# Altium schematic sheet AT-kdSENS.SchDoc
size A4; SheetNumber: 2; SheetTotal: 3
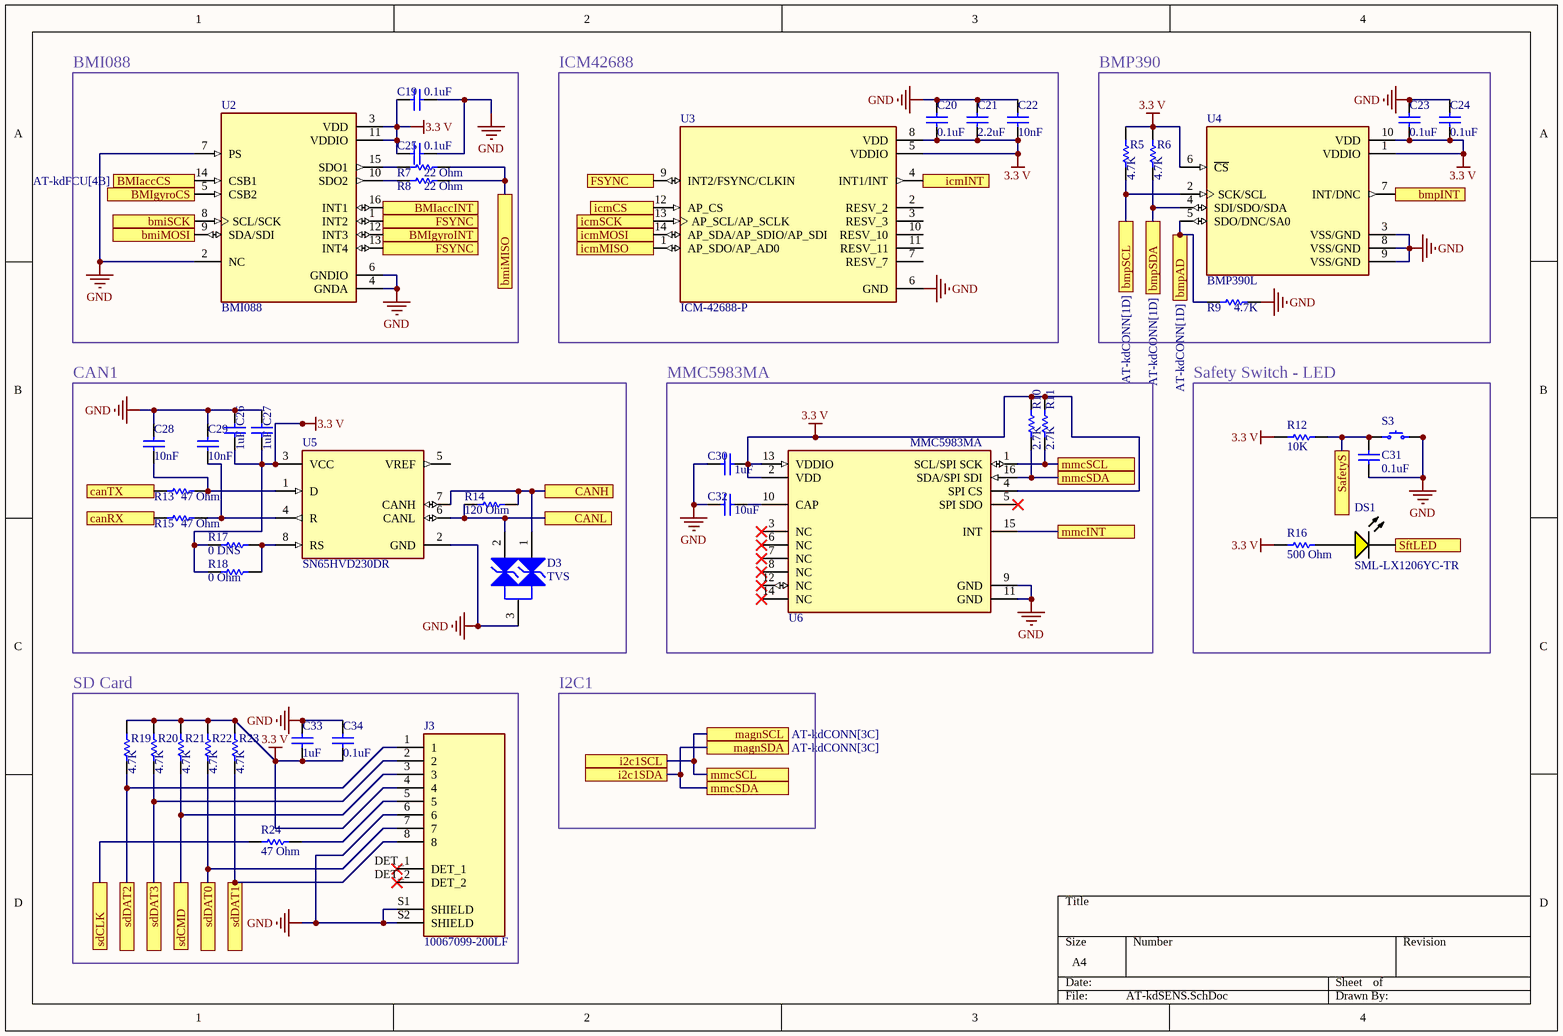
[diagram p0: AT-kdSENS.SchDoc]

## Parts
C19  0.1uF  [Capacitor-0603]
C20  0.1uF  [Capacitor-0603]
C21  2.2uF  [Capacitor-0603]
C22  10nF  [Capacitor-0603]
C23  0.1uF  [Capacitor-0603]
C24  0.1uF  [Capacitor-0603]
C25  0.1uF  [Capacitor-0603]
C26  1uF  [Capacitor-0603]
C27  1uF  [Capacitor-0603]
C28  10nF  [Capacitor-0603]
C29  10nF  [Capacitor-0603]
C30  1uF  [Capacitor-0603]
C31  0.1uF  [Capacitor-0603]
C32  10uF  [Capacitor-0603]
C33  1uF  [Capacitor-0603]
C34  0.1uF  [Capacitor-0603]
D3  TVS  [ONSC-SOT-23-3-318-08_V]
DS1  SML-LX1206YC-TR  [LUMX-SML-LX1206YC-TR_V]
J3  10067099-200LF  [AMPHENOL_10067099-200LF]
R5  4.7K  [Resistor-0603]
R6  4.7K  [Resistor-0603]
R7  22 Ohm  [Resistor-0603]
R8  22 Ohm  [Resistor-0603]
R9  4.7K  [Resistor-0603]
R10  2.7K  [Resistor-0603]
R11  2.7K  [Resistor-0603]
R12  10K  [Resistor-0603]
R13  47 Ohm  [Resistor-0603]
R14  120 Ohm  [Resistor-0603]
R15  47 Ohm  [Resistor-0603]
R16  500 Ohm  [Resistor-0603]
R17  0 DNS  [Resistor-0603]
R18  0 Ohm  [Resistor-0603]
R19  4.7K  [Resistor-0603]
R20  4.7K  [Resistor-0603]
R21  4.7K  [Resistor-0603]
R22  4.7K  [Resistor-0603]
R23  4.7K  [Resistor-0603]
R24  47 Ohm  [Resistor-0603]
S3  PTS810 SJM 250 SMTR LFS  [button]  (value not drawn)
U2  BMI088  [PQFN50P450X300X100-16N]
U3  ICM-42688-P  [PQFN50P300X250X97-14N]
U4  BMP390L  [XDCR_BMP390L]
U5  SN65HVD230DR  [FP-D0008A-IPC_A]
U6  MMC5983MA  [Memsic_0_MFG]

## Blocks framed on the sheet
BMI088: C19 C25 R7 R8 U2
ICM42688: C20-C22 U3
BMP390: C23 C24 R5 R6 R9 U4
CAN1: C26-C29 D3 R13-R15 R17 R18 U5
MMC5983MA: C30 C32 R10 R11 U6
Safety Switch - LED: C31 DS1 R12 R16 S3
SD Card: C33 C34 J3 R19-R24

## Ports
BMIaccCS (see AT-kdFCU[4B]), BMIaccINT (see AT-kdFCU[4B]), BMIgyroCS (see AT-kdFCU[4B]), BMIgyroINT (see AT-kdFCU[4B]), bmiMISO (see AT-kdFCU[3B]), bmiMOSI (see AT-kdFCU[3B]), bmiSCK (see AT-kdFCU[3B]), bmpAD (see AT-kdCONN[1D]), bmpINT (see AT-kdFCU[3C]), bmpSCL (see AT-kdCONN[1D]), bmpSDA (see AT-kdCONN[1D]), CANH (see AT-kdCONN[4C]), CANL (see AT-kdCONN[4C]), canRX (see AT-kdFCU[4A]), canTX (see AT-kdFCU[4A]), FSYNC (see AT-kdFCU[3B], AT-kdSENS[1A]), FSYNC (see AT-kdFCU[3B], AT-kdSENS[1A], AT-kdSENS[2A]), i2c1SCL (see AT-kdFCU[3B]), i2c1SDA (see AT-kdFCU[3B]), icmCS (see AT-kdFCU[4B]), icmINT (see AT-kdFCU[4B]), icmMISO (see AT-kdFCU[3C]), icmMOSI (see AT-kdFCU[3C]), icmSCK (see AT-kdFCU[3C]), magnSCL (see AT-kdCONN[3C]), magnSDA (see AT-kdCONN[3C]), mmcINT (see AT-kdFCU[4B]), mmcSCL (see AT-kdSENS[2D]), mmcSCL (see AT-kdSENS[3B]), mmcSDA (see AT-kdSENS[2D]), mmcSDA (see AT-kdSENS[3B]), SafetyS (see AT-kdFCU[4B]), sdCLK (see AT-kdFCU[3C]), sdCMD (see AT-kdFCU[4A]), sdDAT0 (see AT-kdFCU[3C]), sdDAT1 (see AT-kdFCU[3C]), sdDAT2 (see AT-kdFCU[3C]), sdDAT3 (see AT-kdFCU[3C]), SftLED (see AT-kdFCU[3C])

## Nets
3.3 V: C19.2 C20.2 C21.2 C22.2 C23.2 C24.2 C25.2 C26.1 C27.1 C30.2 C33.2 C34.2 J3.4 R5.2 R6.2 R10.2 R11.2 R12.2 R16.2 R17.1 R18.1 R19.2 R20.2 R21.2 R22.2 R23.2 U2.3(VDD) U2.11(VDDIO) U3.5(VDDIO) U3.8(VDD) U4.1(VDDIO) U4.6(~{CS}) U4.10(VDD) U5.3(VCC) U6.2(VDD) U6.4(SPI_CS) U6.13(VDDIO)
GND: C19.1 C20.1 C21.1 C22.1 C23.1 C24.1 C25.1 C26.2 C27.2 C28.1 C29.1 C30.1 C31.2 C32.1 C33.1 C34.1 D3.3(K) J3.6 J3.S1(SHIELD) J3.S2(SHIELD) R9.2 S3.3 S3.4 U2.2(NC) U2.4(GNDA) U2.6(GNDIO) U2.7(PS) U3.6(GND) U4.3(VSS/GND) U4.8(VSS/GND) U4.9(VSS/GND) U5.2(GND) U6.9(GND) U6.11(GND)
BMIaccCS: U2.14(CSB1) ; port BMIaccCS
BMIaccINT: U2.16(INT1) ; port BMIaccINT
BMIgyroCS: U2.5(CSB2) ; port BMIgyroCS
BMIgyroINT: U2.12(INT3) ; port BMIgyroINT
bmiMISO: R7.2 R8.2 ; port bmiMISO
bmiMOSI: U2.9(SDA/SDI) ; port bmiMOSI
bmiSCK: U2.8(SCL/SCK) ; port bmiSCK
bmpAD: R9.1 U4.5(SDO/DNC/SA0) ; port bmpAD
bmpINT: U4.7(INT/DNC) ; port bmpINT
bmpSCL: R5.1 U4.2(SCK/SCL) ; port bmpSCL
bmpSDA: R6.1 U4.4(SDI/SDO/SDA) ; port bmpSDA
CANH: D3.1(K) R14.2 U5.7(CANH) ; port CANH
CANL: D3.2(K) R14.1 U5.6(CANL) ; port CANL
canRX: R15.1 ; port canRX
canTX: R13.1 ; port canTX
FSYNC: U2.1(INT2) U2.13(INT4) U3.9(INT2/FSYNC/CLKIN) ; port FSYNC
i2c1SCL: R11.1 U6.1(SCL/SPI_SCK) ; port mmcSCL, port i2c1SCL, port magnSCL
i2c1SDA: R10.1 U6.16(SDA/SPI_SDI) ; port mmcSDA, port i2c1SDA, port magnSDA
icmCS: U3.12(AP_CS) ; port icmCS
icmINT: U3.4(INT1/INT) ; port icmINT
icmMISO: U3.1(AP_SDO/AP_AD0) ; port icmMISO
icmMOSI: U3.14(AP_SDA/AP_SDIO/AP_SDI) ; port icmMOSI
icmSCK: U3.13(AP_SCL/AP_SCLK) ; port icmSCK
mmcINT: U6.15(INT) ; port mmcINT
SafetyS: C31.1 R12.1 S3.1 S3.2 ; port SafetyS
sdCLK: R24.2 ; port sdCLK
sdCMD: J3.3 R21.1 ; port sdCMD
sdDAT0: J3.7 R22.1 ; port sdDAT0
sdDAT1: J3.8 R23.1 ; port sdDAT1
sdDAT2: J3.1 R19.1 ; port sdDAT2
sdDAT3: J3.2 R20.1 ; port sdDAT3
SftLED: DS1.2(K) ; port SftLED
NetC28_2: C28.2 R13.2 U5.1(D)
NetC29_2: C29.2 R15.2 U5.4(R)
NetC32_2: C32.2 U6.10(CAP)
NetDS1_1: DS1.1(A) R16.1
NetJ3_5: J3.5 R24.1
NetR7_1: R7.1 U2.15(SDO1)
NetR8_1: R8.1 U2.10(SDO2)
NetR17_2: R17.2 R18.2 U5.8(RS)

Not connected (* = marked no-connect by the designer): J3 DET_1* DET_2*; U3 2(RESV_2) 3(RESV_3) 7(RESV_7) 10(RESV_10) 11(RESV_11); U5 5(VREF); U6 3(NC)* 5(SPI_SDO)* 6(NC)* 7(NC)* 8(NC)* 12(NC)* 14(NC)*

## Notes on the sheet
- I2C1

## Library data of the parts
C19-C34 = 0603-Cap
D3 = CMP-1063-00164-1: Dual Line CAN Bus Protector, 3-Pin SOT-23, Pb-Free, Tape and Reel; PartNumber: NUP2105LT1G; Manufacturer: On Semiconductor; IR Max (uA): 0.1; Number of Lines: 2; Direction: Bidirectional; C Max (pF): 30; PPK Max (W): 350; V(BR) Min (V): 26.2; ComponentLink3URL: http://www.onsemi.cn/pub_link/Collateral/318-08.PDF; Mounting Technology: Surface Mount; ComponentLink2Description: Datasheet; ComponentLink1URL: http://www.onsemi.com/; PackageVersion: Rev. AP, 11/2009; DatasheetVersion: Rev. 5; RoHS: Pb-Free; PackageReference: SOT-23-3-318-08; ComponentLink2URL: http://www.onsemi.cn/pub_link/Collateral/NUP2105L-D.PDF; ComponentLink1Description: Manufacturer URL; PackageDescription: 3-Pin Small Outline Transistor, Body 2.92 x 1.3 mm, Pitch 0.95 mm; Packing: Tape and Reel; ComponentLink3Description: Package Specification
DS1 = CMP-2000-07124-1: Yellow LED, Water Clear Len, 585 nm, 2.1 V, -40 to 85 degC, 2-Pin SMD, RoHS, Tape and Reel; Manufacturer: Lumex; Product Training Modules: LEDsBenefitsofCustomLEDandLCDTechnology; Millicandela Rating: 6mcd; Catalog Drawings: SML-LX1206SeriesTopSML-LX1206SeriesSideSML-LX1206SeriesBottomSML-LX1206SeriesFootprint; Wavelength - Peak: 585nm; Other Names: 67-1358-2LU60357TRSMLLX1206YCTR; Lens Style/Size: RectanglewithFlatTop; Current - Test: 20mA; Lens Color: Colorless; Viewing Angle: 160°; Voltage - Forward (Vf) (Typ): 2.1V; Online Catalog: SML-LX1206RectanglewithFlatTop1206PackageLEDs; Mounting Type: SurfaceMount; Package Description: 2-Pin Surface Mount Device, Body 3.2 x 1.5 mm; Datasheet Version: Rev. K, 08/2012; Features: -; Color: Yellow; RoHS Information: RoHSCertofCompliance; Package Reference: SML-LX1206YC-TR; Supplier Device Package: 1206; Standard Package: 3,000; Series: -; Wavelength - Dominant: -; Package / Case: 1206(3216Metric); Mounting Technology: SurfaceMount; Height (Max): 1.10mm; Lens Transparency: Clear; Datasheet URL: http://www.lumex.com/content/files/ProductAttachment/SML-LX1206YC-TR.pdf; Family: LEDIndication-Discrete; Manufacturer URL: http://www.lumexinstruments.com/; Packaging: Tape&Reel(TR); Category: Optoelectronics; Size / Dimension: 3.20mmLx1.60mmW
J3 = 10067099-200LF: MF: {'manufacturer': u'Amphenol ICC (FCI)'}; Package: None; Price: None; Value: *; MP: 10067099-200LF; Availability: Unavailable
R5-R24 = 0603-Res
S3 = PTS810 SJM 250 SMTR LFS: SWITCH TACTILE SPST-NO 0.05A 16V; Manufacturer: C&K; Actuator Height off PCB, Vertical: 2.50mm; Actuator Orientation: Top Actuated; Actuator Type: Oval Button; Contact Rating @ Voltage: 0.05A @ 16VDC; Illumination: Non-Illuminated; Operating Force: 160gf; Outline: 4.20mm x 3.20mm; Switch Function: Off-Mom; Part Number: PTS810 SJM 250 SMTR LFS; Circuit: SPST-NO; ComponentLink1Description: Datasheet; ComponentLink1URL: https://dznh3ojzb2azq.cloudfront.net/products/Tactile/PTS810/documents/datasheet.pdf; ComponentLink2Description: DigiKey Link; ComponentLink2URL: http://digikey.com/product-detail/en/c-k/PTS810-SJM-250-SMTR-LFS/CKN10502CT-ND/4176673; LastUpdated: 9/04/2020 10:00:13; Lifecycle Status: Active; Minimum Order: 1; Mounting Type: Surface Mount; Operating Temperature: -40°C ~ 85°C; Packaging: TapeAndReel; Part Status: Active; Price: 0.16; Series: PTS810; Supplier 1: DigiKey; Supplier Part Number 1: CKN10502CT-ND; Termination Style: J Lead
U2 = BMI088: High-performance 6-axis inertial sensor (accelerometer + gyroscope) <a href="https://pricing.snapeda.com/parts/BMI088/Bosch%20Sensortec/view-part?ref=eda">Check prices</a>; Package: None; MP: BMI088; Value: *; Availability: Unavailable; Price: None
U3 = ICM-42688-P: Accelerometer, Gyroscope, 6 Axis Sensor Output; Package: None; MP: ICM-42688-P; Value: *; Availability: Unavailable; Price: None
U4 = BMP390L: Pressure Sensor 4.35PSI ~ 18.13PSI (30kPa ~ 125kPa) Absolute - - 10-WFLGA; MF: Bosch Sensortec; SnapEDA_Link: https://www.snapeda.com/parts/BMP390L/Bosch+Sensortec/view-part/?ref=snap; Package: None; Value: *; MP: BMP390L; Check_prices: https://www.snapeda.com/parts/BMP390L/Bosch+Sensortec/view-part/?ref=eda
U5 = CMP-0315-00015-3: IC TRANSCEIVER HALF 1/1 8SOIC; Number of Transceivers: 1; Operating Supply Voltage: 3.3V; Number of I/Os: 2; Max Supply Current: 17mA; Max Supply Voltage: 3.6V; Min Supply Voltage: 3V; Data Rate: 1Mbps; Min Operating Temperature: -40°C; Packaging: Tape and Reel; Lead Free: Lead Free; Number of Transmit Buffers: 1; Max Operating Temperature: 85°C; Number of Receive Buffers: 1; Number of Pins: 8; Package Quantity: 1; Radiation Hardening: No; Case/Package: D; REACH SVHC: No SVHC; Weight: 0.002561oz; Termination: SMD/SMT; Contact Plating: Gold; Nominal Supply Current: 17mA; Number of Receivers: 1; Number of Drivers: 1